# EAGLE design keyboard (EAGLE 9.7.0)
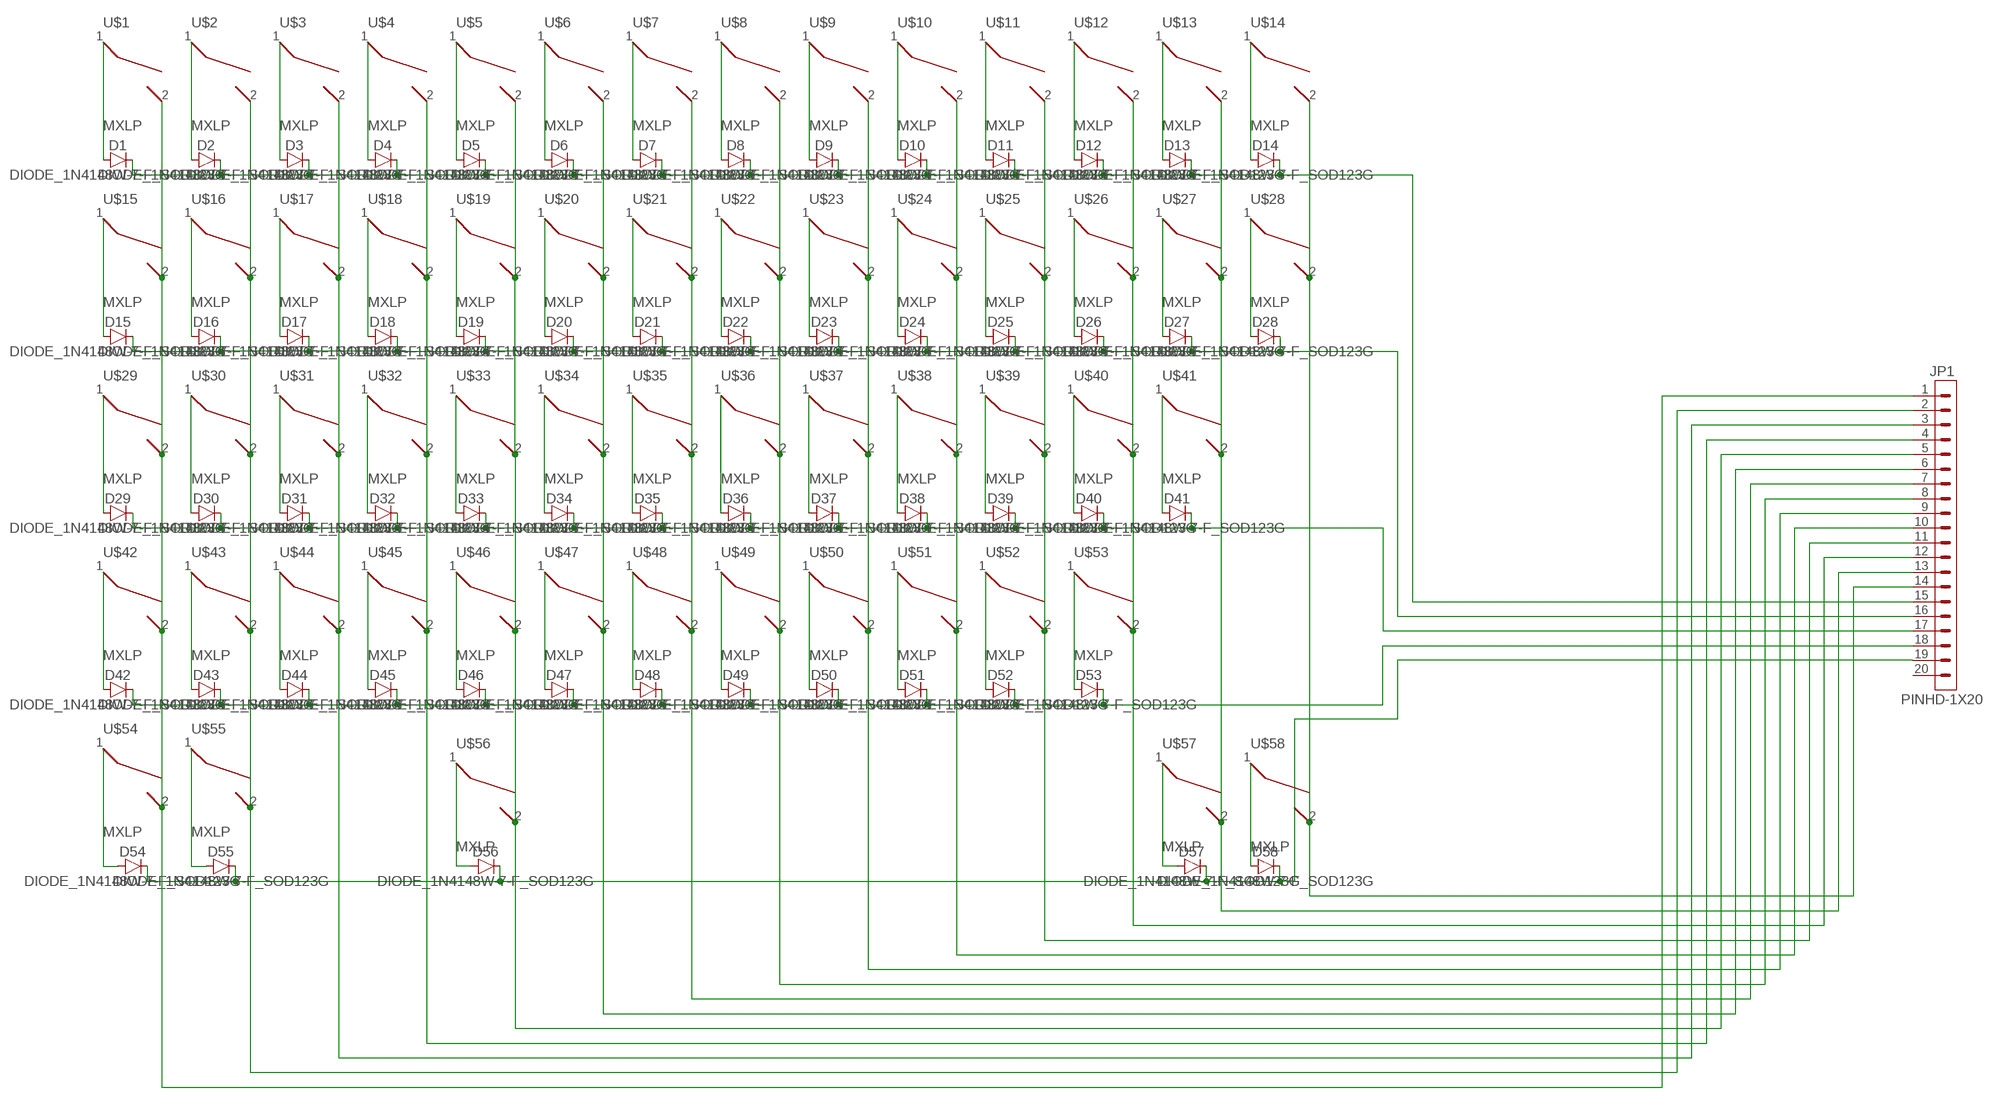
[diagram p0: schematic, sheet 1]

## Parts
D1  DIODE_1N4148W-7-F_SOD123G  [SOD3715X135]
D2  DIODE_1N4148W-7-F_SOD123G  [SOD3715X135]
D3  DIODE_1N4148W-7-F_SOD123G  [SOD3715X135]
D4  DIODE_1N4148W-7-F_SOD123G  [SOD3715X135]
D5  DIODE_1N4148W-7-F_SOD123G  [SOD3715X135]
D6  DIODE_1N4148W-7-F_SOD123G  [SOD3715X135]
D7  DIODE_1N4148W-7-F_SOD123G  [SOD3715X135]
D8  DIODE_1N4148W-7-F_SOD123G  [SOD3715X135]
D9  DIODE_1N4148W-7-F_SOD123G  [SOD3715X135]
D10  DIODE_1N4148W-7-F_SOD123G  [SOD3715X135]
D11  DIODE_1N4148W-7-F_SOD123G  [SOD3715X135]
D12  DIODE_1N4148W-7-F_SOD123G  [SOD3715X135]
D13  DIODE_1N4148W-7-F_SOD123G  [SOD3715X135]
D14  DIODE_1N4148W-7-F_SOD123G  [SOD3715X135]
D15  DIODE_1N4148W-7-F_SOD123G  [SOD3715X135]
D16  DIODE_1N4148W-7-F_SOD123G  [SOD3715X135]
D17  DIODE_1N4148W-7-F_SOD123G  [SOD3715X135]
D18  DIODE_1N4148W-7-F_SOD123G  [SOD3715X135]
D19  DIODE_1N4148W-7-F_SOD123G  [SOD3715X135]
D20  DIODE_1N4148W-7-F_SOD123G  [SOD3715X135]
D21  DIODE_1N4148W-7-F_SOD123G  [SOD3715X135]
D22  DIODE_1N4148W-7-F_SOD123G  [SOD3715X135]
D23  DIODE_1N4148W-7-F_SOD123G  [SOD3715X135]
D24  DIODE_1N4148W-7-F_SOD123G  [SOD3715X135]
D25  DIODE_1N4148W-7-F_SOD123G  [SOD3715X135]
D26  DIODE_1N4148W-7-F_SOD123G  [SOD3715X135]
D27  DIODE_1N4148W-7-F_SOD123G  [SOD3715X135]
D28  DIODE_1N4148W-7-F_SOD123G  [SOD3715X135]
D29  DIODE_1N4148W-7-F_SOD123G  [SOD3715X135]
D30  DIODE_1N4148W-7-F_SOD123G  [SOD3715X135]
D31  DIODE_1N4148W-7-F_SOD123G  [SOD3715X135]
D32  DIODE_1N4148W-7-F_SOD123G  [SOD3715X135]
D33  DIODE_1N4148W-7-F_SOD123G  [SOD3715X135]
D34  DIODE_1N4148W-7-F_SOD123G  [SOD3715X135]
D35  DIODE_1N4148W-7-F_SOD123G  [SOD3715X135]
D36  DIODE_1N4148W-7-F_SOD123G  [SOD3715X135]
D37  DIODE_1N4148W-7-F_SOD123G  [SOD3715X135]
D38  DIODE_1N4148W-7-F_SOD123G  [SOD3715X135]
D39  DIODE_1N4148W-7-F_SOD123G  [SOD3715X135]
D40  DIODE_1N4148W-7-F_SOD123G  [SOD3715X135]
D41  DIODE_1N4148W-7-F_SOD123G  [SOD3715X135]
D42  DIODE_1N4148W-7-F_SOD123G  [SOD3715X135]
D43  DIODE_1N4148W-7-F_SOD123G  [SOD3715X135]
D44  DIODE_1N4148W-7-F_SOD123G  [SOD3715X135]
D45  DIODE_1N4148W-7-F_SOD123G  [SOD3715X135]
D46  DIODE_1N4148W-7-F_SOD123G  [SOD3715X135]
D47  DIODE_1N4148W-7-F_SOD123G  [SOD3715X135]
D48  DIODE_1N4148W-7-F_SOD123G  [SOD3715X135]
D49  DIODE_1N4148W-7-F_SOD123G  [SOD3715X135]
D50  DIODE_1N4148W-7-F_SOD123G  [SOD3715X135]
D51  DIODE_1N4148W-7-F_SOD123G  [SOD3715X135]
D52  DIODE_1N4148W-7-F_SOD123G  [SOD3715X135]
D53  DIODE_1N4148W-7-F_SOD123G  [SOD3715X135]
D54  DIODE_1N4148W-7-F_SOD123G  [SOD3715X135]
D55  DIODE_1N4148W-7-F_SOD123G  [SOD3715X135]
D56  DIODE_1N4148W-7-F_SOD123G  [SOD3715X135]
D57  DIODE_1N4148W-7-F_SOD123G  [SOD3715X135]
D58  DIODE_1N4148W-7-F_SOD123G  [SOD3715X135]
JP1  PINHD-1X20  [1X20]
U$1  MXLP  [CHERRY-MX-LOW-PROFILE]
U$2  MXLP  [CHERRY-MX-LOW-PROFILE]
U$3  MXLP  [CHERRY-MX-LOW-PROFILE]
U$4  MXLP  [CHERRY-MX-LOW-PROFILE]
U$5  MXLP  [CHERRY-MX-LOW-PROFILE]
U$6  MXLP  [CHERRY-MX-LOW-PROFILE]
U$7  MXLP  [CHERRY-MX-LOW-PROFILE]
U$8  MXLP  [CHERRY-MX-LOW-PROFILE]
U$9  MXLP  [CHERRY-MX-LOW-PROFILE]
U$10  MXLP  [CHERRY-MX-LOW-PROFILE]
U$11  MXLP  [CHERRY-MX-LOW-PROFILE]
U$12  MXLP  [CHERRY-MX-LOW-PROFILE]
U$13  MXLP  [CHERRY-MX-LOW-PROFILE]
U$14  MXLP  [CHERRY-MX-LOW-PROFILE]
U$15  MXLP  [CHERRY-MX-LOW-PROFILE]
U$16  MXLP  [CHERRY-MX-LOW-PROFILE]
U$17  MXLP  [CHERRY-MX-LOW-PROFILE]
U$18  MXLP  [CHERRY-MX-LOW-PROFILE]
U$19  MXLP  [CHERRY-MX-LOW-PROFILE]
U$20  MXLP  [CHERRY-MX-LOW-PROFILE]
U$21  MXLP  [CHERRY-MX-LOW-PROFILE]
U$22  MXLP  [CHERRY-MX-LOW-PROFILE]
U$23  MXLP  [CHERRY-MX-LOW-PROFILE]
U$24  MXLP  [CHERRY-MX-LOW-PROFILE]
U$25  MXLP  [CHERRY-MX-LOW-PROFILE]
U$26  MXLP  [CHERRY-MX-LOW-PROFILE]
U$27  MXLP  [CHERRY-MX-LOW-PROFILE]
U$28  MXLP  [CHERRY-MX-LOW-PROFILE]
U$29  MXLP  [CHERRY-MX-LOW-PROFILE]
U$30  MXLP  [CHERRY-MX-LOW-PROFILE]
U$31  MXLP  [CHERRY-MX-LOW-PROFILE]
U$32  MXLP  [CHERRY-MX-LOW-PROFILE]
U$33  MXLP  [CHERRY-MX-LOW-PROFILE]
U$34  MXLP  [CHERRY-MX-LOW-PROFILE]
U$35  MXLP  [CHERRY-MX-LOW-PROFILE]
U$36  MXLP  [CHERRY-MX-LOW-PROFILE]
U$37  MXLP  [CHERRY-MX-LOW-PROFILE]
U$38  MXLP  [CHERRY-MX-LOW-PROFILE]
U$39  MXLP  [CHERRY-MX-LOW-PROFILE]
U$40  MXLP  [CHERRY-MX-LOW-PROFILE]
U$41  MXLP  [CHERRY-MX-LOW-PROFILE]
U$42  MXLP  [CHERRY-MX-LOW-PROFILE]
U$43  MXLP  [CHERRY-MX-LOW-PROFILE]
U$44  MXLP  [CHERRY-MX-LOW-PROFILE]
U$45  MXLP  [CHERRY-MX-LOW-PROFILE]
U$46  MXLP  [CHERRY-MX-LOW-PROFILE]
U$47  MXLP  [CHERRY-MX-LOW-PROFILE]
U$48  MXLP  [CHERRY-MX-LOW-PROFILE]
U$49  MXLP  [CHERRY-MX-LOW-PROFILE]
U$50  MXLP  [CHERRY-MX-LOW-PROFILE]
U$51  MXLP  [CHERRY-MX-LOW-PROFILE]
U$52  MXLP  [CHERRY-MX-LOW-PROFILE]
U$53  MXLP  [CHERRY-MX-LOW-PROFILE]
U$54  MXLP  [CHERRY-MX-LOW-PROFILE]
U$55  MXLP  [CHERRY-MX-LOW-PROFILE]
U$56  MXLP  [CHERRY-MX-LOW-PROFILE]
U$57  MXLP  [CHERRY-MX-LOW-PROFILE]
U$58  MXLP  [CHERRY-MX-LOW-PROFILE]

## Nets
N$1: D1.2(A) U$1.1
N$2: D2.2(A) U$2.1
N$3: JP1.3 U$3.2 U$17.2 U$31.2 U$44.2
N$4: D3.2(A) U$3.1
N$5: D4.2(A) U$4.1
N$6: D5.2(A) U$5.1
N$7: D6.2(A) U$6.1
N$8: D7.2(A) U$7.1
N$9: D8.2(A) U$8.1
N$10: D9.2(A) U$9.1
N$11: D10.2(A) U$10.1
N$12: D11.2(A) U$11.1
N$13: D12.2(A) U$12.1
N$14: D13.2(A) U$13.1
N$15: D14.2(A) U$14.1
N$16: D15.2(A) U$15.1
N$17: D16.2(A) U$16.1
N$18: D17.2(A) U$17.1
N$19: D18.2(A) U$18.1
N$20: D19.2(A) U$19.1
N$21: D20.2(A) U$20.1
N$22: D21.2(A) U$21.1
N$23: D22.2(A) U$22.1
N$24: D23.2(A) U$23.1
N$25: D24.2(A) U$24.1
N$26: D25.2(A) U$25.1
N$27: D26.2(A) U$26.1
N$28: D27.2(A) U$27.1
N$29: D28.2(A) U$28.1
N$30: D15.1(C) D16.1(C) D17.1(C) D18.1(C) D19.1(C) D20.1(C) D21.1(C) D22.1(C) D23.1(C) D24.1(C) D25.1(C) D26.1(C) D27.1(C) D28.1(C) JP1.16
N$31: D29.2(A) U$29.1
N$32: D30.2(A) U$30.1
N$33: D31.2(A) U$31.1
N$34: D32.2(A) U$32.1
N$35: D33.2(A) U$33.1
N$36: D34.2(A) U$34.1
N$37: D35.2(A) U$35.1
N$38: D36.2(A) U$36.1
N$39: D37.2(A) U$37.1
N$40: D38.2(A) U$38.1
N$41: D39.2(A) U$39.1
N$42: D40.2(A) U$40.1
N$43: D41.2(A) U$41.1
N$44: D29.1(C) D30.1(C) D31.1(C) D32.1(C) D33.1(C) D34.1(C) D35.1(C) D36.1(C) D37.1(C) D38.1(C) D39.1(C) D40.1(C) D41.1(C) JP1.17
N$45: D42.2(A) U$42.1
N$46: D43.2(A) U$43.1
N$47: D44.2(A) U$44.1
N$48: D45.2(A) U$45.1
N$49: D46.2(A) U$46.1
N$50: D47.2(A) U$47.1
N$51: D48.2(A) U$48.1
N$52: D49.2(A) U$49.1
N$53: D50.2(A) U$50.1
N$54: D51.2(A) U$51.1
N$55: D52.2(A) U$52.1
N$56: D53.2(A) U$53.1
N$57: D42.1(C) D43.1(C) D44.1(C) D45.1(C) D46.1(C) D47.1(C) D48.1(C) D49.1(C) D50.1(C) D51.1(C) D52.1(C) D53.1(C) JP1.18
N$58: D54.2(A) U$54.1
N$59: D55.2(A) U$55.1
N$60: D56.2(A) U$56.1
N$61: D57.2(A) U$57.1
N$62: D58.2(A) U$58.1
N$63: D54.1(C) D55.1(C) D56.1(C) D57.1(C) D58.1(C) JP1.19
N$64: JP1.1 U$1.2 U$15.2 U$29.2 U$42.2 U$54.2
N$65: JP1.2 U$2.2 U$16.2 U$30.2 U$43.2 U$55.2
N$67: JP1.4 U$4.2 U$18.2 U$32.2 U$45.2
N$68: JP1.5 U$5.2 U$19.2 U$33.2 U$46.2 U$56.2
N$69: JP1.6 U$6.2 U$20.2 U$34.2 U$47.2
N$70: JP1.7 U$7.2 U$21.2 U$35.2 U$48.2
N$71: JP1.8 U$8.2 U$22.2 U$36.2 U$49.2
N$72: JP1.9 U$9.2 U$23.2 U$37.2 U$50.2
N$73: JP1.10 U$10.2 U$24.2 U$38.2 U$51.2
N$74: JP1.11 U$11.2 U$25.2 U$39.2 U$52.2
N$75: JP1.12 U$12.2 U$26.2 U$40.2 U$53.2
N$76: JP1.13 U$13.2 U$27.2 U$41.2 U$57.2
N$77: JP1.14 U$14.2 U$28.2 U$58.2
ROW1: D1.1(C) D2.1(C) D3.1(C) D4.1(C) D5.1(C) D6.1(C) D7.1(C) D8.1(C) D9.1(C) D10.1(C) D11.1(C) D12.1(C) D13.1(C) D14.1(C) JP1.15
Unconnected: JP1.20

## Library data of the parts
D1-D58 = Diode:DIODE_: Diode Rectifier - Popular Parts; CATEGORY: Diode; DATASHEET: https://www.diodes.com/datasheet/download/1N4148W.pdf; DESCRIPTION: Diode 100 V 300mA Surface Mount SOD-123; FORWARD_CURRENT: 150mA; FORWARD_VOLTAGE: 1.25V; MANUFACTURER: Diodes Incorporated; MPN: 1N4148W-7-F; OPERATING_TEMPERATURE: -55°C ~ 150°C; PACKAGE_SIZE: SOD-123; PACKAGE_TYPE: Surface Mount; PART_STATUS: Active; REVERSE_VOLTAGE: 100V; ROHS: Compliant; SERIES: 1N4148; SUBCATEGORY: Rectifiers; TYPE: Small Signal Switching Diodes; ZENER_VOLTAGE: NA
JP1 = Connector:PINHD-1X20: Pin Header; CATEGORY: Connectors; DESCRIPTION: Header-Straight-10 Position; PACKAGE_TYPE: Through Hole; PITCH: 0.100" (2.54mm); SUBCATEGORY: Headers; TYPE: Male Pins
U$1-U$58 = Cherry-MX-Low-Profile:MXLP

## Board
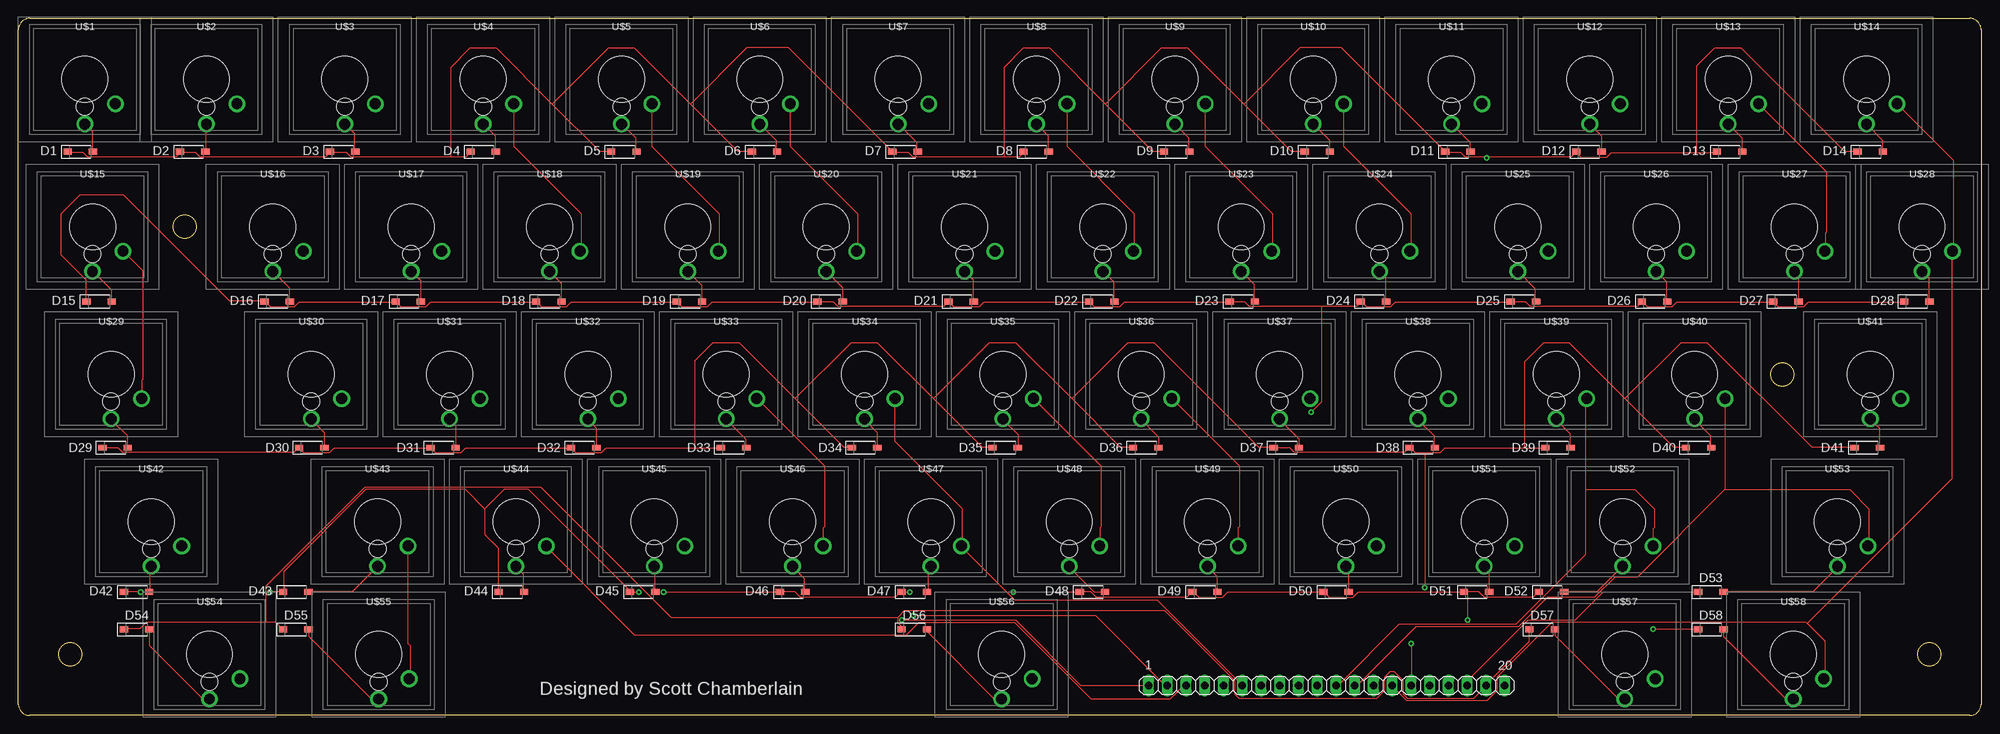
[diagram p1: board, top side]
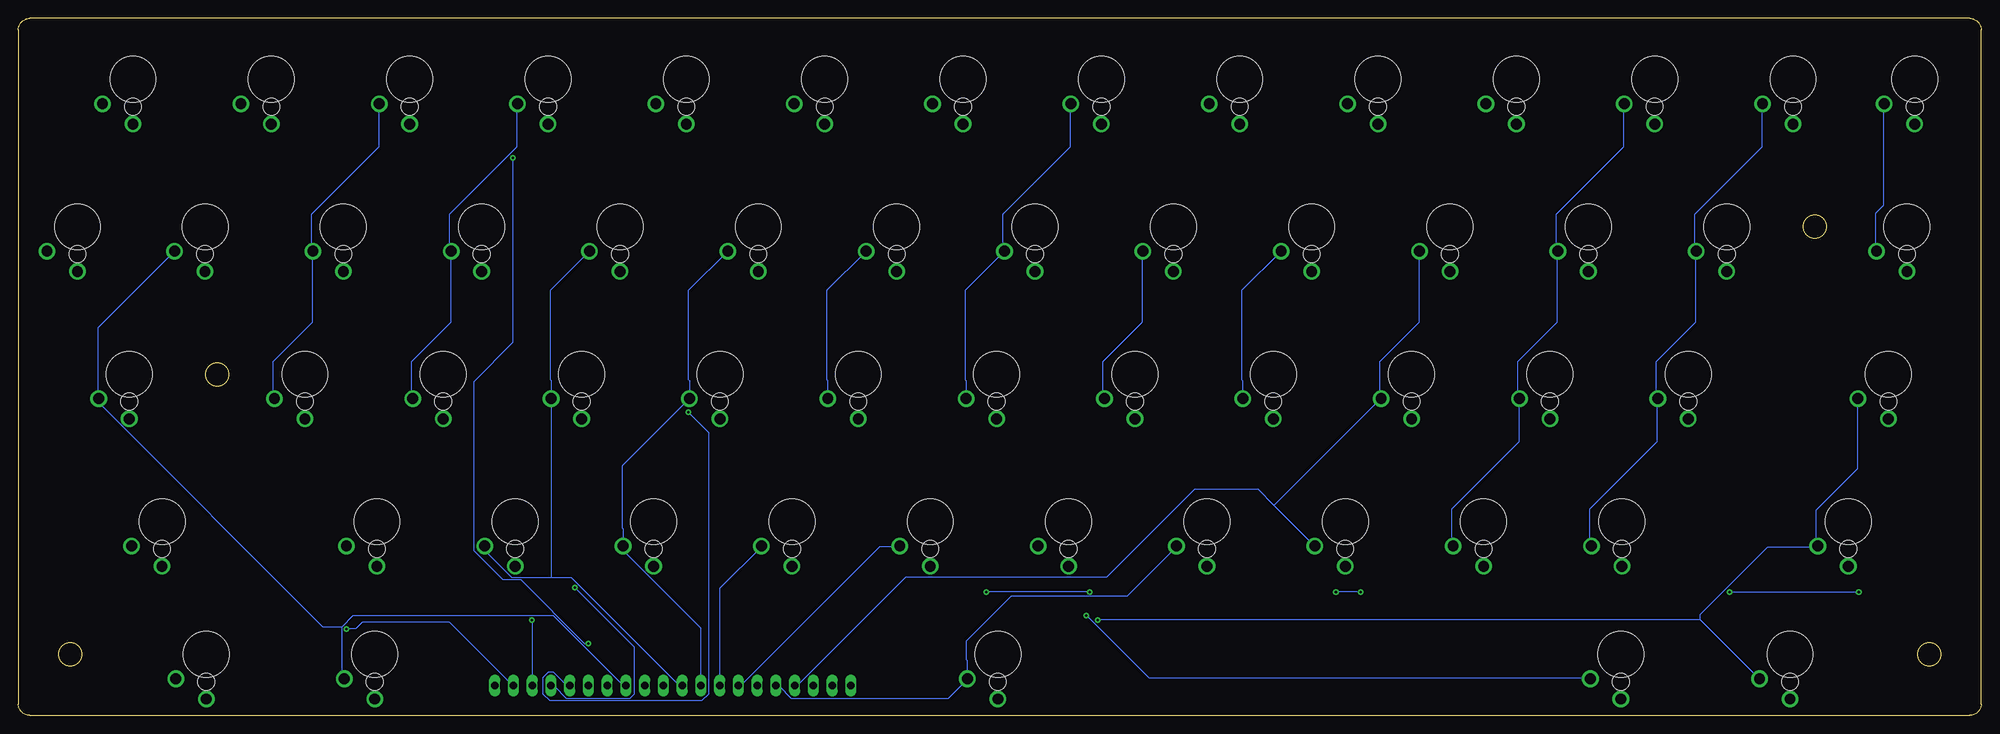
[diagram p2: board, bottom side, seen from below]

Size 266 x 94.5 mm. Coordinates in mm from the lower left corner, seen from the top.
Outline: 0,1.5 arc90 1.5,0 264.5,0 arc90 266,1.5 266,93 arc90 264.5,94.5 1.5,94.5 arc90 0,93 0,1.5
Outline: circle at 259,8.25 radius 1.55
Outline: circle at 239.09,46.25 radius 1.55
Outline: circle at 22.5,66.25 radius 1.55
Outline: circle at 7,8.25 radius 1.55
Copper layers (1*16): Top 0.035mm / dielectric 1.5mm / Bottom 0.035mm
Design rules "Fusion Electronics Design Rules": minimum track width 6mil, minimum drill 0.35mm, track to track 6mil, track to pad 6mil, pad to pad 6mil, via to via 6mil, smd to smd 6mil, copper to edge 40mil, drill to drill 6mil, minimum pad ring 10mil, minimum via ring 8mil, stop-mask expansion 4mil, vias tented up to drill 9999mil, thermal gap 10mil

### Footprints (pad centres in the part's own frame; a part is rotated, then mirrored left to right if it is on the bottom)
SOD3715X135 = smd 1.127 x 0.784: 1 -1.722,0; 2 1.722,0
1X20 = drill 1.016 long: 1 -24.13,0; 2 -21.59,0; 3 -19.05,0; 4 -16.51,0; 5 -13.97,0; 6 -11.43,0; 7 -8.89,0; 8 -6.35,0; 9 -3.81,0; 10 -1.27,0; 11 1.27,0; 12 3.81,0; 13 6.35,0; 14 8.89,0; 15 11.43,0; 16 13.97,0; 17 16.51,0; 18 19.05,0; 19 21.59,0; 20 24.13,0
CHERRY-MX-LOW-PROFILE = drill 1.47 pad 2.25: 1 0,-6.05; 2 4.13,-3.3 | hole 2.3: 0,-3.7 | hole 6.25: 0,0

### Placement (x,y rotation side)
D1  8.39,76.43 0 top
D2  23.63,76.43 0 top
D3  43.95,76.43 0 top
D4  63,76.43 0 top
D5  82.05,76.43 0 top
D6  101.1,76.43 0 top
D7  120.15,76.43 0 top
D8  137.93,76.43 0 top
D9  156.98,76.43 0 top
D10  176.03,76.43 0 top
D11  195.08,76.43 0 top
D12  212.86,76.43 0 top
D13  231.91,76.43 0 top
D14  250.96,76.43 0 top
D15  10.93,56.11 0 top
D16  35.06,56.11 0 top
D17  52.84,56.11 0 top
D18  71.89,56.11 0 top
D19  90.94,56.11 0 top
D20  109.99,56.11 0 top
D21  127.77,56.11 0 top
D22  146.82,56.11 0 top
D23  165.87,56.11 0 top
D24  183.65,56.11 0 top
D25  203.97,56.11 0 top
D26  221.75,56.11 0 top
D27  239.53,56.11 0 top
D28  257.31,56.11 0 top
D29  13.09,36.3 0 top
D30  39.76,36.3 0 top
D31  57.54,36.3 0 top
D32  76.59,36.3 0 top
D33  96.91,36.3 0 top
D34  114.69,36.3 0 top
D35  133.74,36.3 0 top
D36  152.79,36.3 0 top
D37  171.84,36.3 0 top
D38  190.25,36.3 0 top
D39  208.67,36.3 0 top
D40  227.72,36.3 0 top
D41  250.58,36.3 0 top
D42  16.01,16.74 0 top
D43  37.6,16.74 0 top
D44  66.81,16.74 0 top
D45  84.59,16.74 0 top
D46  104.91,16.74 0 top
D47  121.42,16.74 0 top
D48  145.55,16.74 0 top
D49  160.79,16.74 0 top
D50  178.57,16.74 0 top
D51  197.62,16.74 0 top
D52  207.78,16.74 0 top
D53  229.37,16.74 0 top
D54  16.01,11.66 0 top
D55  37.6,11.66 0 top
D56  121.42,11.66 0 top
D57  206.51,11.66 0 top
D58  229.37,11.66 0 top
JP1  177.3,4.04 0 top
U$1  9,86.23 0 top
U$2  25.48,86.23 0 top
U$3  44.23,86.23 0 top
U$4  62.98,86.23 0 top
U$5  81.73,86.23 0 top
U$6  100.48,86.23 0 top
U$7  119.23,86.23 0 top
U$8  137.98,86.23 0 top
U$9  156.73,86.23 0 top
U$10  175.48,86.23 0 top
U$11  194.23,86.23 0 top
U$12  212.97,86.23 0 top
U$13  231.72,86.23 0 top
U$14  250.48,86.23 0 top
U$15  10.04,66.24 0 top
U$16  34.48,66.24 0 top
U$17  53.22,66.24 0 top
U$18  71.97,66.24 0 top
U$19  90.72,66.24 0 top
U$20  109.47,66.24 0 top
U$21  128.22,66.24 0 top
U$22  146.97,66.24 0 top
U$23  165.72,66.24 0 top
U$24  184.47,66.24 0 top
U$25  203.22,66.24 0 top
U$26  221.97,66.24 0 top
U$27  240.71,66.24 0 top
U$28  258,66.24 0 top
U$29  12.56,46.25 0 top
U$30  39.68,46.25 0 top
U$31  58.43,46.25 0 top
U$32  77.18,46.25 0 top
U$33  95.93,46.25 0 top
U$34  114.68,46.25 0 top
U$35  133.43,46.25 0 top
U$36  152.18,46.25 0 top
U$37  170.93,46.25 0 top
U$38  189.67,46.25 0 top
U$39  208.42,46.25 0 top
U$40  227.17,46.25 0 top
U$41  250.99,46.25 0 top
U$42  17.99,26.27 0 top
U$43  48.67,26.27 0 top
U$44  67.42,26.27 0 top
U$45  86.17,26.27 0 top
U$46  104.92,26.27 0 top
U$47  123.67,26.27 0 top
U$48  142.42,26.27 0 top
U$49  161.17,26.27 0 top
U$50  179.92,26.27 0 top
U$51  198.67,26.27 0 top
U$52  217.42,26.27 0 top
U$53  246.54,26.27 0 top
U$54  25.89,8.27 0 top
U$55  48.83,8.27 0 top
U$56  133.26,8.27 0 top
U$57  217.71,8.27 0 top
U$58  240.55,8.27 0 top

### Tracks (layer width: path | path; a pad name or v marks a point on that pad's centre or on a via)
N$1
  Top 0.152: D1.2 10.02,76.48 10.02,79.22 9.1,80.14 U$1.1
N$2
  Top 0.152: D2.2 25.41,76.48 25.41,80.14 U$2.1
N$3
  Top 0.152: JP1.3 158.15,3.94 157.84,3.94 156.17,2.26 145.35,2.26 134.98,12.62 122.03,12.62 120.35,10.95 83.47,10.95 71.58,22.84 U$44.2
  Bottom 0.152: U$3.2 48.42,82.88 48.42,77.09 57.56,67.95 57.56,63.22 57.41,63.07 U$17.2 57.41,62.92 57.41,53.32 62.75,47.98 62.75,43.26 62.59,43.1 U$31.2 62.59,42.95 62.59,37.16 71.74,28.02 71.74,23.14 71.58,22.99 U$44.2
N$4
  Top 0.152: D3.2 45.52,76.48 45.52,78.92 44.31,80.14 U$3.1
N$5
  Top 0.152: D4.2 64.58,76.48 64.58,78.61 63.05,80.14 U$4.1
N$6
  Top 0.152: D5.2 83.62,76.48 83.62,78.31 81.8,80.14 U$5.1
N$7
  Top 0.152: D6.2 102.67,76.48 102.67,78 100.54,80.14 U$6.1
N$8
  Top 0.152: D7.2 121.72,76.48 121.72,77.7 119.29,80.14 U$7.1
N$9
  Top 0.152: D8.2 139.56,76.48 139.56,78.61 138.03,80.14 U$8.1
N$10
  Top 0.152: D9.2 158.61,76.48 158.61,78.31 156.78,80.14 U$9.1
N$11
  Top 0.152: D10.2 177.66,76.48 177.66,78 175.52,80.14 U$10.1
N$12
  Top 0.152: D11.2 196.71,76.48 196.71,77.7 194.27,80.14 U$11.1
N$13
  Top 0.152: D12.2 214.54,76.48 214.54,78.61 213.01,80.14 U$12.1
N$14
  Top 0.152: D13.2 233.59,76.48 233.59,78.31 231.76,80.14 U$13.1
N$15
  Top 0.152: D14.2 252.64,76.48 252.64,78 250.5,80.14 U$14.1
N$16
  Top 0.152: D15.2 12.61,56.21 12.61,57.74 10.17,60.17 U$15.1
N$17
  Top 0.152: D16.2 36.69,56.21 36.69,58.04 34.55,60.17 U$16.1
N$18
  Top 0.152: D17.2 54.52,56.21 54.52,58.95 53.3,60.17 U$17.1
N$19
  Top 0.152: D18.2 73.57,56.21 73.57,58.65 72.04,60.17 U$18.1
N$20
  Top 0.152: D19.2 92.62,56.21 92.62,58.34 90.79,60.17 U$19.1
N$21
  Top 0.152: D20.2 111.67,56.21 111.67,58.04 109.53,60.17 U$20.1
N$22
  Top 0.152: D21.2 129.34,56.21 129.34,59.11 128.28,60.17 U$21.1
N$23
  Top 0.152: D22.2 148.4,56.21 148.4,58.8 147.02,60.17 U$22.1
N$24
  Top 0.152: D23.2 167.44,56.21 167.44,58.5 165.77,60.17 U$23.1
N$25
  Top 0.152: D24.2 185.28,56.21 185.28,59.41 184.51,60.17 U$24.1
N$26
  Top 0.152: D25.2 205.54,56.21 205.54,57.89 203.26,60.17 U$25.1
N$27
  Top 0.152: D26.2 223.38,56.21 223.38,58.8 222,60.17 U$26.1
N$28
  Top 0.152: D27.2 241.21,56.21 241.21,59.72 240.75,60.17 U$27.1
N$29
  Top 0.152: D28.2 258.88,56.21 258.88,59.41 258.12,60.17 U$28.1
N$30  (via drill 0.35)
  Top 0.152: D28.1 255.53,56.06 242.58,56.06 241.97,55.45 238.46,55.45 237.85,56.06 D27.1 237.7,56.06 224.75,56.06 224.14,55.45 220.78,55.45 220.18,56.06 D26.1 220.02,56.06 219.41,55.45 204.94,55.45 204.33,56.06 202.34,56.06 D25.1 202.19,56.06 186.65,56.06 186.04,55.45 182.69,55.45 182.07,56.06 D24.1 181.92,56.06 181.31,55.45 176.59,55.45 | 176.59,55.45 166.84,55.45 166.23,56.06 164.24,56.06 D23.1 164.09,56.06 149.92,56.06 149.31,55.45 145.8,55.45 145.19,56.06 D22.1 145.04,56.06 130.87,56.06 130.26,55.45 126.75,55.45 126.14,56.06 D21.1 125.99,56.06 125.38,55.45 111.06,55.45 110.45,56.06 108.31,56.06 D20.1 108.16,56.06 93.99,56.06 93.38,55.45 89.87,55.45 89.26,56.06 D19.1 89.11,56.06 74.94,56.06 74.33,55.45 70.82,55.45 70.21,56.06 D18.1 70.06,56.06 55.89,56.06 55.28,55.45 51.77,55.45 51.16,56.06 D17.1 51.01,56.06 38.06,56.06 37.45,55.45 34.09,55.45 33.48,56.06 D16.1 33.33,56.21 28.61,56.21 14.28,70.54 8.34,70.54 5.75,67.95 5.75,62.46 9.1,59.11 9.1,56.21 D15.1 | v175.22,41.12 176.59,42.5 176.59,55.45
  Bottom 0.152: v175.22,41.12 172.47,38.38 172.47,2.87 173.39,1.96 193.96,1.96 194.88,2.87 194.88,5.16 194.12,5.92 193.5,5.92 191.68,4.09 191.37,4.09 JP1.16
N$31
  Top 0.152: D29.2 14.74,36.4 14.74,37.92 12.61,40.06 U$29.1
N$32
  Top 0.152: D30.2 41.41,36.4 41.41,38.38 39.73,40.06 U$30.1
N$33
  Top 0.152: D31.2 59.24,36.4 59.24,39.3 58.48,40.06 U$31.1
N$34
  Top 0.152: D32.2 78.29,36.4 78.29,38.99 77.22,40.06 U$32.1
N$35
  Top 0.152: D33.2 98.56,36.4 98.56,37.47 95.97,40.06 U$33.1
N$36
  Top 0.152: D34.2 116.39,36.4 116.39,38.38 114.71,40.06 U$34.1
N$37
  Top 0.152: D35.2 135.44,36.4 135.44,38.08 133.46,40.06 U$35.1
N$38
  Top 0.152: D36.2 154.49,36.4 154.49,37.77 152.21,40.06 U$36.1
N$39
  Top 0.152: D37.2 173.54,36.4 173.54,37.47 170.95,40.06 U$37.1
N$40
  Top 0.152: D38.2 191.83,36.4 191.83,37.92 189.69,40.06 U$38.1
N$41
  Top 0.152: D39.2 210.27,36.4 210.27,38.23 208.44,40.06 U$39.1
N$42
  Top 0.152: D40.2 229.32,36.4 229.32,37.92 227.19,40.06 U$40.1
N$43
  Top 0.152: D41.2 252.18,36.4 252.18,38.99 251.11,40.06 U$41.1
N$44  (via drill 0.35)
  Top 0.152: 204.17,36.25 193.35,36.25 192.74,35.64 190.61,35.64 | 204.17,36.25 206.92,36.25 D39.1 | 190.61,35.64 189.24,35.64 188.63,36.25 D38.1 188.48,36.25 187.87,35.64 172.93,35.64 172.32,36.25 170.19,36.25 D37.1 170.04,36.4 168.05,36.4 153.88,50.57 150.38,50.57 142.76,42.95 | 217.74,42.95 210.12,50.57 206.76,50.57 204.17,47.98 204.17,36.25 | 217.74,42.95 224.29,36.4 225.97,36.4 D40.1 | 217.74,42.95 225.36,50.57 228.86,50.57 243.03,36.4 248.83,36.4 D41.1 | 190.61,35.64 v190.61,17.35 | D29.1 11.39,36.25 13.52,36.25 14.13,35.64 37.3,35.64 37.91,36.25 D30.1 38.06,36.25 38.67,35.64 42.17,35.64 42.78,36.25 55.74,36.25 D31.1 55.89,36.25 56.5,35.64 60,35.64 60.61,36.25 74.79,36.25 D32.1 74.94,36.25 75.55,35.64 79.05,35.64 79.66,36.25 91.7,36.25 | 91.7,36.25 95.06,36.25 D33.1 | 105.27,42.95 97.65,50.57 94.14,50.57 91.7,48.13 91.7,36.25 | 105.27,42.95 111.82,36.4 112.89,36.4 D34.1 | 124.01,42.95 116.39,50.57 112.89,50.57 105.27,42.95 | 124.01,42.95 130.56,36.4 131.94,36.4 D35.1 | 142.76,42.95 135.14,50.57 131.63,50.57 124.01,42.95 | 142.76,42.95 149.31,36.4 150.99,36.4 D36.1
  Bottom 0.152: v190.61,17.35 182.53,9.27 182.53,2.87 183.14,2.26 191.68,2.26 193.35,3.94 193.81,3.94 JP1.17
N$45
  Top 0.152: D42.2 17.79,16.74 17.79,19.94 17.94,20.09 U$42.1
N$46
  Top 0.152: D43.2 45.22,16.74 48.57,20.09 U$43.1
N$47
  Top 0.152: D44.2 68.39,16.74 68.39,19.18 67.47,20.09 U$44.1
N$48
  Top 0.152: D45.2 86.22,16.74 86.22,20.09 U$45.1
N$49
  Top 0.152: D46.2 106.48,16.74 106.48,18.57 104.96,20.09 U$46.1
N$50
  Top 0.152: D47.2 123.25,16.74 123.25,19.79 123.55,20.09 U$47.1
N$51
  Top 0.152: D48.2 145.8,16.74 142.45,20.09 U$48.1
N$52
  Top 0.152: D49.2 162.42,16.74 162.42,18.87 161.2,20.09 U$49.1
N$53
  Top 0.152: D50.2 180.25,16.74 180.25,19.79 179.94,20.09 U$50.1
N$54
  Top 0.152: D51.2 199.3,16.74 199.3,19.48 198.69,20.09 U$51.1
N$55
  Top 0.152: D52.2 213.93,16.74 217.28,20.09 U$52.1
N$56
  Top 0.152: D53.2 243.19,16.74 246.54,20.09 U$53.1
N$57  (via drill 0.35)
  Top 0.152: D53.1 214.84,16.74 211.03,12.93 204.63,12.93 196.4,4.7 196.4,4.09 JP1.18 | 196.4,16.74 197.93,16.74 198.69,15.98 205.24,15.98 206,16.74 D52.1 | 196.4,16.74 D51.1 | D51.1 181.62,16.74 180.86,15.98 177.66,15.98 176.89,16.74 D50.1 163.94,16.74 163.18,15.98 159.98,15.98 159.22,16.74 D49.1 158.3,15.98 146.11,15.98 145.35,16.74 D48.1 v134.83,16.74 | 196.4,16.74 v196.4,12.93 | 195.94,16.74 D51.1 | v16.57,16.74 D42.1 | v34.09,16.74 D43.1 35.92,16.74 35.92,19.48 47.05,30.61 60.61,30.61 63.2,28.02 | 63.2,28.02 63.2,24.51 65.03,22.68 65.03,16.74 D44.1 | 63.2,28.02 65.79,30.61 69.15,30.61 83.02,16.74 | v87.44,16.74 D46.1 105.27,16.74 106.03,15.98 118.83,15.98 119.59,16.74 D47.1 v120.81,16.74 | 83.02,16.74 v84.08,16.74 | 83.02,16.74 D45.1
  Bottom 0.152: v196.4,12.93 196.4,4.09 JP1.18 | v34.09,16.74 v16.57,16.74 | v84.08,16.74 v87.44,16.74 | v120.81,16.74 v134.83,16.74
N$58
  Top 0.152: D54.2 17.79,11.56 17.79,9.43 24.95,2.26 25.86,2.26 U$54.1
N$59
  Top 0.152: D55.2 39.43,11.56 39.43,10.64 47.81,2.26 48.73,2.26 U$55.1
N$60
  Top 0.152: D56.2 123.25,11.56 123.25,11.25 132.24,2.26 133.16,2.26 U$56.1
N$61
  Top 0.152: D57.2 208.29,11.56 208.29,10.8 216.82,2.26 217.58,2.26 U$57.1
N$62
  Top 0.152: D58.2 231.15,11.56 231.15,10.64 239.53,2.26 240.44,2.26 U$58.1
N$63  (via drill 0.35)
  Top 0.152: 33.48,12.62 34.86,12.62 35.77,11.71 D55.1 | 33.48,12.62 17.33,12.62 16.42,11.71 14.44,11.71 D54.1 | 119.13,13.23 119.13,12.62 119.59,12.17 119.59,11.71 D56.1 | 119.13,13.23 120.05,14.15 155.41,14.15 164.85,4.7 164.85,2.87 165.46,2.26 184.06,2.26 185.12,3.33 185.12,5.16 185.88,5.92 186.5,5.92 187.71,4.7 187.71,2.87 188.32,2.26 197.16,2.26 198.84,3.94 JP1.19 198.84,4.09 204.78,10.03 204.78,11.56 D57.1 | v221.55,11.71 227.64,11.71 D58.1 | 33.48,12.62 33.48,17.5 46.9,30.91 70.82,30.91 88.5,13.23 119.13,13.23
  Bottom 0.152: v221.55,11.71 220.33,11.71 219.41,12.62 207.53,12.62 198.99,4.09 JP1.19
N$64  (via drill 0.35)
  Top 0.152: U$29.2 16.72,43.1 16.72,45.39 16.87,45.54 16.87,60.33 14.28,62.92 U$15.2 | v119.74,12.93 135.14,12.93 143.97,4.09 153.12,4.09 JP1.1
  Bottom 0.152: U$1.2 13.22,82.88 13.22,69.17 14.28,68.1 14.28,63.07 U$15.2 | 38.06,12.93 v119.74,12.93 | 38.06,12.93 30.13,5 U$54.2 | 22.36,22.84 28.91,22.84 38.06,13.69 38.06,12.93 | 22.36,22.84 22.21,22.84 U$42.2 22.36,22.84 | 22.36,22.84 22.36,27.86 16.72,33.5 16.72,42.95 U$29.2
N$65  (via drill 0.35)
  Top 0.152: v121.27,13.54 145.96,13.54 155.41,4.09 155.71,4.09 JP1.2 | U$43.2 52.84,22.84 52.84,9.73 53.15,9.43 53.15,5.16 52.99,5 U$55.2
  Bottom 0.152: U$2.2 29.68,82.88 29.68,77.09 38.82,67.95 38.82,63.22 38.67,63.07 U$16.2 38.67,62.92 38.67,53.32 44,47.98 44,43.26 43.85,43.1 U$30.2 43.85,42.95 43.85,37.16 52.99,28.02 52.99,23.14 52.84,22.99 U$43.2 | v121.27,13.54 112.73,5 52.99,5 U$55.2
N$67
  Top 0.152: U$4.2 67.17,82.88 67.17,77.09 76.31,67.95 76.31,63.22 76.16,63.07 U$18.2
  Bottom 0.152: 95.82,28.48 90.33,22.99 U$45.2 | 95.82,28.48 97.95,30.61 106.64,30.61 118.52,18.72 145.8,18.72 160.43,4.09 160.74,4.09 JP1.4 | 95.82,28.48 81.34,42.95 U$32.2 81.34,43.1 81.49,43.26 81.49,47.98 76.16,53.32 76.16,62.92 U$18.2
N$68
  Top 0.152: U$5.2 85.91,82.88 85.91,77.09 95.06,67.95 95.06,63.22 94.9,63.07 U$19.2 | U$46.2 109.08,22.99 109.08,25.43 109.23,25.58 109.23,33.81 100.08,42.95 U$33.2
  Bottom 0.152: JP1.5 163.33,3.94 162.87,3.94 161.2,2.26 140.01,2.26 137.42,4.85 U$56.2 137.42,5 137.42,7.44 137.57,7.6 137.57,10.03 131.48,16.13 115.78,16.13 109.08,22.84 U$46.2 | U$33.2 100.08,43.1 100.08,45.39 100.24,45.54 100.24,57.58 94.9,62.92 U$19.2
N$69
  Top 0.152: U$6.2 104.66,82.88 104.66,77.09 113.8,67.95 113.8,63.22 113.65,63.07 U$20.2 | JP1.6 165.77,4.09 165.16,4.7 165.16,4.85 154.34,15.67 134.98,15.67 127.82,22.84 U$47.2 127.82,22.99 127.97,23.14 127.97,28.02 118.83,37.16 118.83,42.95 U$34.2
  Bottom 0.152: U$20.2 113.65,62.92 113.65,53.32 118.98,47.98 118.98,43.26 118.83,43.1 U$34.2
N$70
  Top 0.152: U$48.2 146.57,22.99 146.57,25.43 146.72,25.58 146.72,33.81 137.57,42.95 U$35.2
  Bottom 0.152: JP1.7 168.36,4.09 168.05,4.09 149.31,22.84 146.57,22.84 U$48.2 | U$35.2 137.57,43.1 137.57,45.39 137.73,45.54 137.73,57.58 132.39,62.92 U$21.2 132.39,63.07 132.54,63.22 132.54,67.95 123.4,77.09 123.4,82.88 U$7.2
N$71
  Top 0.152: U$8.2 142.15,82.88 142.15,77.09 151.29,67.95 151.29,63.22 151.14,63.07 U$22.2 | U$49.2 165.31,22.99 165.31,25.43 165.46,25.58 165.46,33.81 U$36.2
  Bottom 0.152: JP1.8 170.95,17.2 165.31,22.84 U$49.2 | U$36.2 156.32,43.1 156.32,45.39 156.47,45.54 156.47,57.58 151.14,62.92 U$22.2
N$72
  Top 0.152: U$9.2 160.89,82.88 160.89,77.09 170.04,67.95 170.04,63.22 169.88,63.07 U$23.2
  Bottom 0.152: JP1.9 173.54,4.09 173.54,11.86 183.9,22.23 183.9,22.84 U$50.2 184.06,22.99 184.06,25.27 184.21,25.43 184.21,33.81 U$37.2 175.06,43.1 175.06,45.39 175.22,45.54 175.22,57.58 169.88,62.92 U$23.2
N$73
  Top 0.152: U$10.2 179.64,82.88 179.64,77.09 188.78,67.95 188.78,63.22 188.63,63.07 U$24.2
  Bottom 0.152: 193.81,18.72 199.14,18.72 202.65,22.23 202.65,22.84 U$51.2 | 193.81,18.72 191.07,18.72 176.44,4.09 176.13,4.09 JP1.10 | U$24.2 188.63,62.92 193.96,57.58 193.96,45.54 193.81,45.39 193.81,43.1 U$38.2 193.81,18.72
N$74
  Top 0.152: 212.4,30.61 212.4,42.95 U$39.2 | 212.4,30.61 212.4,21.77 202.95,12.32 187.1,12.32 178.88,4.09 178.57,4.09 JP1.11 | 212.4,30.61 219.11,30.61 221.7,28.02 221.7,25.43 221.55,25.27 221.55,22.99 U$52.2
  Bottom 0.152: U$39.2 212.56,43.1 212.71,43.26 212.71,47.98 207.37,53.32 207.37,62.92 U$25.2 207.37,63.07 207.53,63.22 207.53,67.95 198.38,77.09 198.38,82.88 U$11.2
N$75
  Top 0.152: 231.3,30.61 219.41,18.72 216.37,18.72 213.62,15.98 207.22,15.98 203.26,12.02 189.39,12.02 181.47,4.09 181.16,4.09 JP1.12 | 231.3,30.61 U$40.2 | 231.3,30.61 248.22,30.61 250.81,28.02 250.81,22.99 U$53.2
  Bottom 0.152: U$40.2 231.45,43.1 231.45,47.98 226.12,53.32 226.12,62.92 U$26.2 226.12,63.07 226.27,63.22 226.27,67.95 217.13,77.09 217.13,82.88 U$12.2
N$76
  Top 0.152: U$27.2 244.86,63.07 244.86,65.36 245.02,65.51 245.02,73.74 235.87,82.88 U$13.2
  Bottom 0.152: 222.16,12.02 220.63,13.54 193.5,13.54 184.06,4.09 183.75,4.09 JP1.13 | 222.16,12.02 222.16,5.31 221.85,5 U$57.2 | U$27.2 244.86,62.92 255.23,52.55 255.23,43.1 U$41.2 255.07,42.95 255.07,42.34 224.75,12.02 222.16,12.02
N$77
  Top 0.152: U$14.2 254.62,82.88 262.24,75.26 262.24,63.07 U$28.2 262.08,62.92 262.08,32.13 242.43,12.47 | 242.43,12.47 244.86,10.03 244.86,5.16 244.71,5 U$58.2 | 242.43,12.47 242.27,12.62 207.83,12.62 200.36,5.16 200.36,3.33 198.99,1.96 188.17,1.96 186.19,3.94 JP1.14
ROW1  (via drill 0.35)
  Top 0.152: D1.1 6.82,76.33 8.8,76.33 9.41,75.72 21.29,75.72 21.9,76.33 D2.1 22.05,76.33 24.04,76.33 24.65,75.72 41.56,75.72 42.17,76.33 D3.1 42.32,76.33 44.46,76.33 45.07,75.72 58.63,75.72 | 58.63,75.72 60.61,75.72 61.22,76.33 D4.1 | 72.35,82.88 64.73,90.5 61.22,90.5 58.63,87.91 58.63,75.72 | 72.35,82.88 78.75,76.48 80.27,76.48 D5.1 | 91.09,82.88 83.47,90.5 79.97,90.5 72.35,82.88 | 91.09,82.88 97.49,76.48 99.32,76.48 D6.1 | 133.61,75.72 135.59,75.72 136.2,76.33 D8.1 | 133.61,75.72 121.27,75.72 120.66,76.33 118.52,76.33 D7.1 118.37,76.48 104.35,90.5 98.71,90.5 91.09,82.88 | 147.33,82.88 139.71,90.5 136.2,90.5 133.61,87.91 133.61,75.72 | 147.33,82.88 153.73,76.48 155.25,76.48 D9.1 | 166.07,82.88 158.45,90.5 154.95,90.5 147.33,82.88 | 166.07,82.88 172.47,76.48 174.3,76.48 D10.1 | 198.99,75.72 210.42,75.72 211.03,76.33 D12.1 211.18,76.33 211.79,75.72 215.3,75.72 215.91,76.33 227.49,76.33 | 198.99,75.72 196.1,75.72 195.49,76.33 193.5,76.33 D11.1 193.35,76.48 179.33,90.5 173.69,90.5 166.07,82.88 | 227.49,76.33 230.08,76.33 D13.1 | 227.49,76.33 227.49,88.06 229.93,90.5 233.43,90.5 247.46,76.48 249.13,76.48 D14.1 | v188.78,9.73 188.78,4.09 JP1.15 | 198.99,75.72 v198.99,75.57
  Bottom 0.152: v188.78,9.73 189.24,9.73 197.93,18.42 200.36,18.42 204.33,22.38 204.33,45.24 198.99,50.57 v198.99,75.57

### Text on the board
tNames: 1 | 20 | Designed by Scott Chamberlain